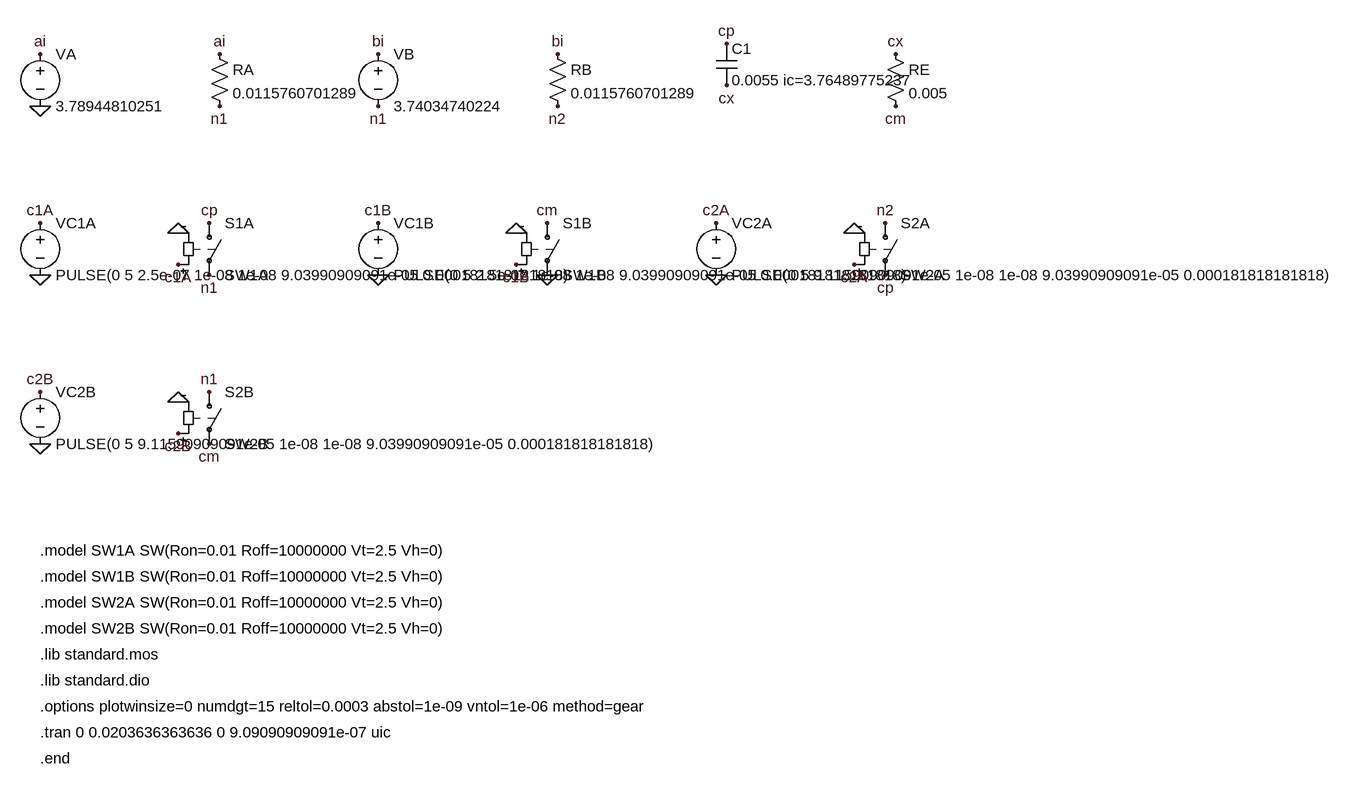
[diagram p0: schematic flying_cap_ideal.asc]
flying_cap_ideal.asc, the LTspice schematic file:
Version 4
SHEET 1 1880 1200
SYMBOL voltage 160 120 R0
SYMATTR InstName VA
SYMATTR Value 3.78944810251
FLAG 160 136 ai
FLAG 160 216 0
SYMBOL res 420 120 R0
SYMATTR InstName RA
SYMATTR Value 0.0115760701289
FLAG 436 136 ai
FLAG 436 216 n1
SYMBOL voltage 680 120 R0
SYMATTR InstName VB
SYMATTR Value 3.74034740224
FLAG 680 136 bi
FLAG 680 216 n1
SYMBOL res 940 120 R0
SYMATTR InstName RB
SYMATTR Value 0.0115760701289
FLAG 956 136 bi
FLAG 956 216 n2
SYMBOL cap 1200 120 R0
SYMATTR InstName C1
SYMATTR Value 0.0055 ic=3.76489775237
FLAG 1216 120 cp
FLAG 1216 184 cx
SYMBOL res 1460 120 R0
SYMATTR InstName RE
SYMATTR Value 0.005
FLAG 1476 136 cx
FLAG 1476 216 cm
SYMBOL voltage 160 380 R0
SYMATTR InstName VC1A
SYMATTR Value PULSE(0 5 2.5e-07 1e-08 1e-08 9.03990909091e-05 0.000181818181818)
FLAG 160 396 c1A
FLAG 160 476 0
SYMBOL sw 420 380 R0
SYMATTR InstName S1A
SYMATTR Value SW1A
FLAG 420 396 cp
FLAG 420 476 n1
FLAG 372 460 c1A
FLAG 372 412 0
SYMBOL voltage 680 380 R0
SYMATTR InstName VC1B
SYMATTR Value PULSE(0 5 2.5e-07 1e-08 1e-08 9.03990909091e-05 0.000181818181818)
FLAG 680 396 c1B
FLAG 680 476 0
SYMBOL sw 940 380 R0
SYMATTR InstName S1B
SYMATTR Value SW1B
FLAG 940 396 cm
FLAG 940 476 0
FLAG 892 460 c1B
FLAG 892 412 0
SYMBOL voltage 1200 380 R0
SYMATTR InstName VC2A
SYMATTR Value PULSE(0 5 9.11590909091e-05 1e-08 1e-08 9.03990909091e-05 0.000181818181818)
FLAG 1200 396 c2A
FLAG 1200 476 0
SYMBOL sw 1460 380 R0
SYMATTR InstName S2A
SYMATTR Value SW2A
FLAG 1460 396 n2
FLAG 1460 476 cp
FLAG 1412 460 c2A
FLAG 1412 412 0
SYMBOL voltage 160 640 R0
SYMATTR InstName VC2B
SYMATTR Value PULSE(0 5 9.11590909091e-05 1e-08 1e-08 9.03990909091e-05 0.000181818181818)
FLAG 160 656 c2B
FLAG 160 736 0
SYMBOL sw 420 640 R0
SYMATTR InstName S2B
SYMATTR Value SW2B
FLAG 420 656 n1
FLAG 420 736 cm
FLAG 372 720 c2B
FLAG 372 672 0
TEXT 160 900 Left 2 !.model SW1A SW(Ron=0.01 Roff=10000000 Vt=2.5 Vh=0)
TEXT 160 940 Left 2 !.model SW1B SW(Ron=0.01 Roff=10000000 Vt=2.5 Vh=0)
TEXT 160 980 Left 2 !.model SW2A SW(Ron=0.01 Roff=10000000 Vt=2.5 Vh=0)
TEXT 160 1020 Left 2 !.model SW2B SW(Ron=0.01 Roff=10000000 Vt=2.5 Vh=0)
TEXT 160 1060 Left 2 !.lib standard.mos
TEXT 160 1100 Left 2 !.lib standard.dio
TEXT 160 1140 Left 2 !.options plotwinsize=0 numdgt=15 reltol=0.0003 abstol=1e-09 vntol=1e-06 method=gear
TEXT 160 1180 Left 2 !.tran 0 0.0203636363636 0 9.09090909091e-07 uic
TEXT 160 1220 Left 2 !.end

The netlist it stands for:
* flying_cap_ideal.asc
VA ai 0 3.78944810251
RA ai n1 0.0115760701289
VB bi n1 3.74034740224
RB bi n2 0.0115760701289
C1 cp cx 0.0055 ic=3.76489775237
RE cx cm 0.005
VC1A c1A 0 PULSE(0 5 2.5e-07 1e-08 1e-08 9.03990909091e-05 0.000181818181818)
S1A cp n1 c1A 0 SW1A
VC1B c1B 0 PULSE(0 5 2.5e-07 1e-08 1e-08 9.03990909091e-05 0.000181818181818)
S1B cm 0 c1B 0 SW1B
VC2A c2A 0 PULSE(0 5 9.11590909091e-05 1e-08 1e-08 9.03990909091e-05 0.000181818181818)
S2A n2 cp c2A 0 SW2A
VC2B c2B 0 PULSE(0 5 9.11590909091e-05 1e-08 1e-08 9.03990909091e-05 0.000181818181818)
S2B n1 cm c2B 0 SW2B
.model SW1A SW(Ron=0.01 Roff=10000000 Vt=2.5 Vh=0)
.model SW1B SW(Ron=0.01 Roff=10000000 Vt=2.5 Vh=0)
.model SW2A SW(Ron=0.01 Roff=10000000 Vt=2.5 Vh=0)
.model SW2B SW(Ron=0.01 Roff=10000000 Vt=2.5 Vh=0)
.lib standard.mos
.lib standard.dio
.options plotwinsize=0 numdgt=15 reltol=0.0003 abstol=1e-09 vntol=1e-06 method=gear
.tran 0 0.0203636363636 0 9.09090909091e-07 uic
.end
.backanno
.end